# Altium schematic sheet main.SchDoc: Наименование
size 594 x 420 mm; ApprovedBy: Утвердил; CheckedBy: Проверил; Author: Разработал; CompanyName: Организация; SheetNumber: 1; SheetTotal: 9; PageSetup: Record=PageOptions|CenterHorizontal=True|CenterVertical=True|PrintScale=0.94|XCorrection=1.00|YCorrection=1.00|PrintKind=1|BorderSize=5000000|LeftOffset=0|BottomOffset=0|Orientation=1|PaperLength=1000|PaperWidth=1000|Scale=100|PaperSource=7|PrintQuality=-4|MediaType=1|DitherType=10|PaperKind=A4|PrintScaleMode=1; DecimalNumber: Децимальный номер; HeadOfSector: Нач. сектора; MainDevice: Перв.примен.; Name1: Наименование1; lit_A: О; n_kontr: Н. Контр; t_kontr: Т. Контр; Name2: Наименование2; DocumentName: Sheet1.SCHDOC
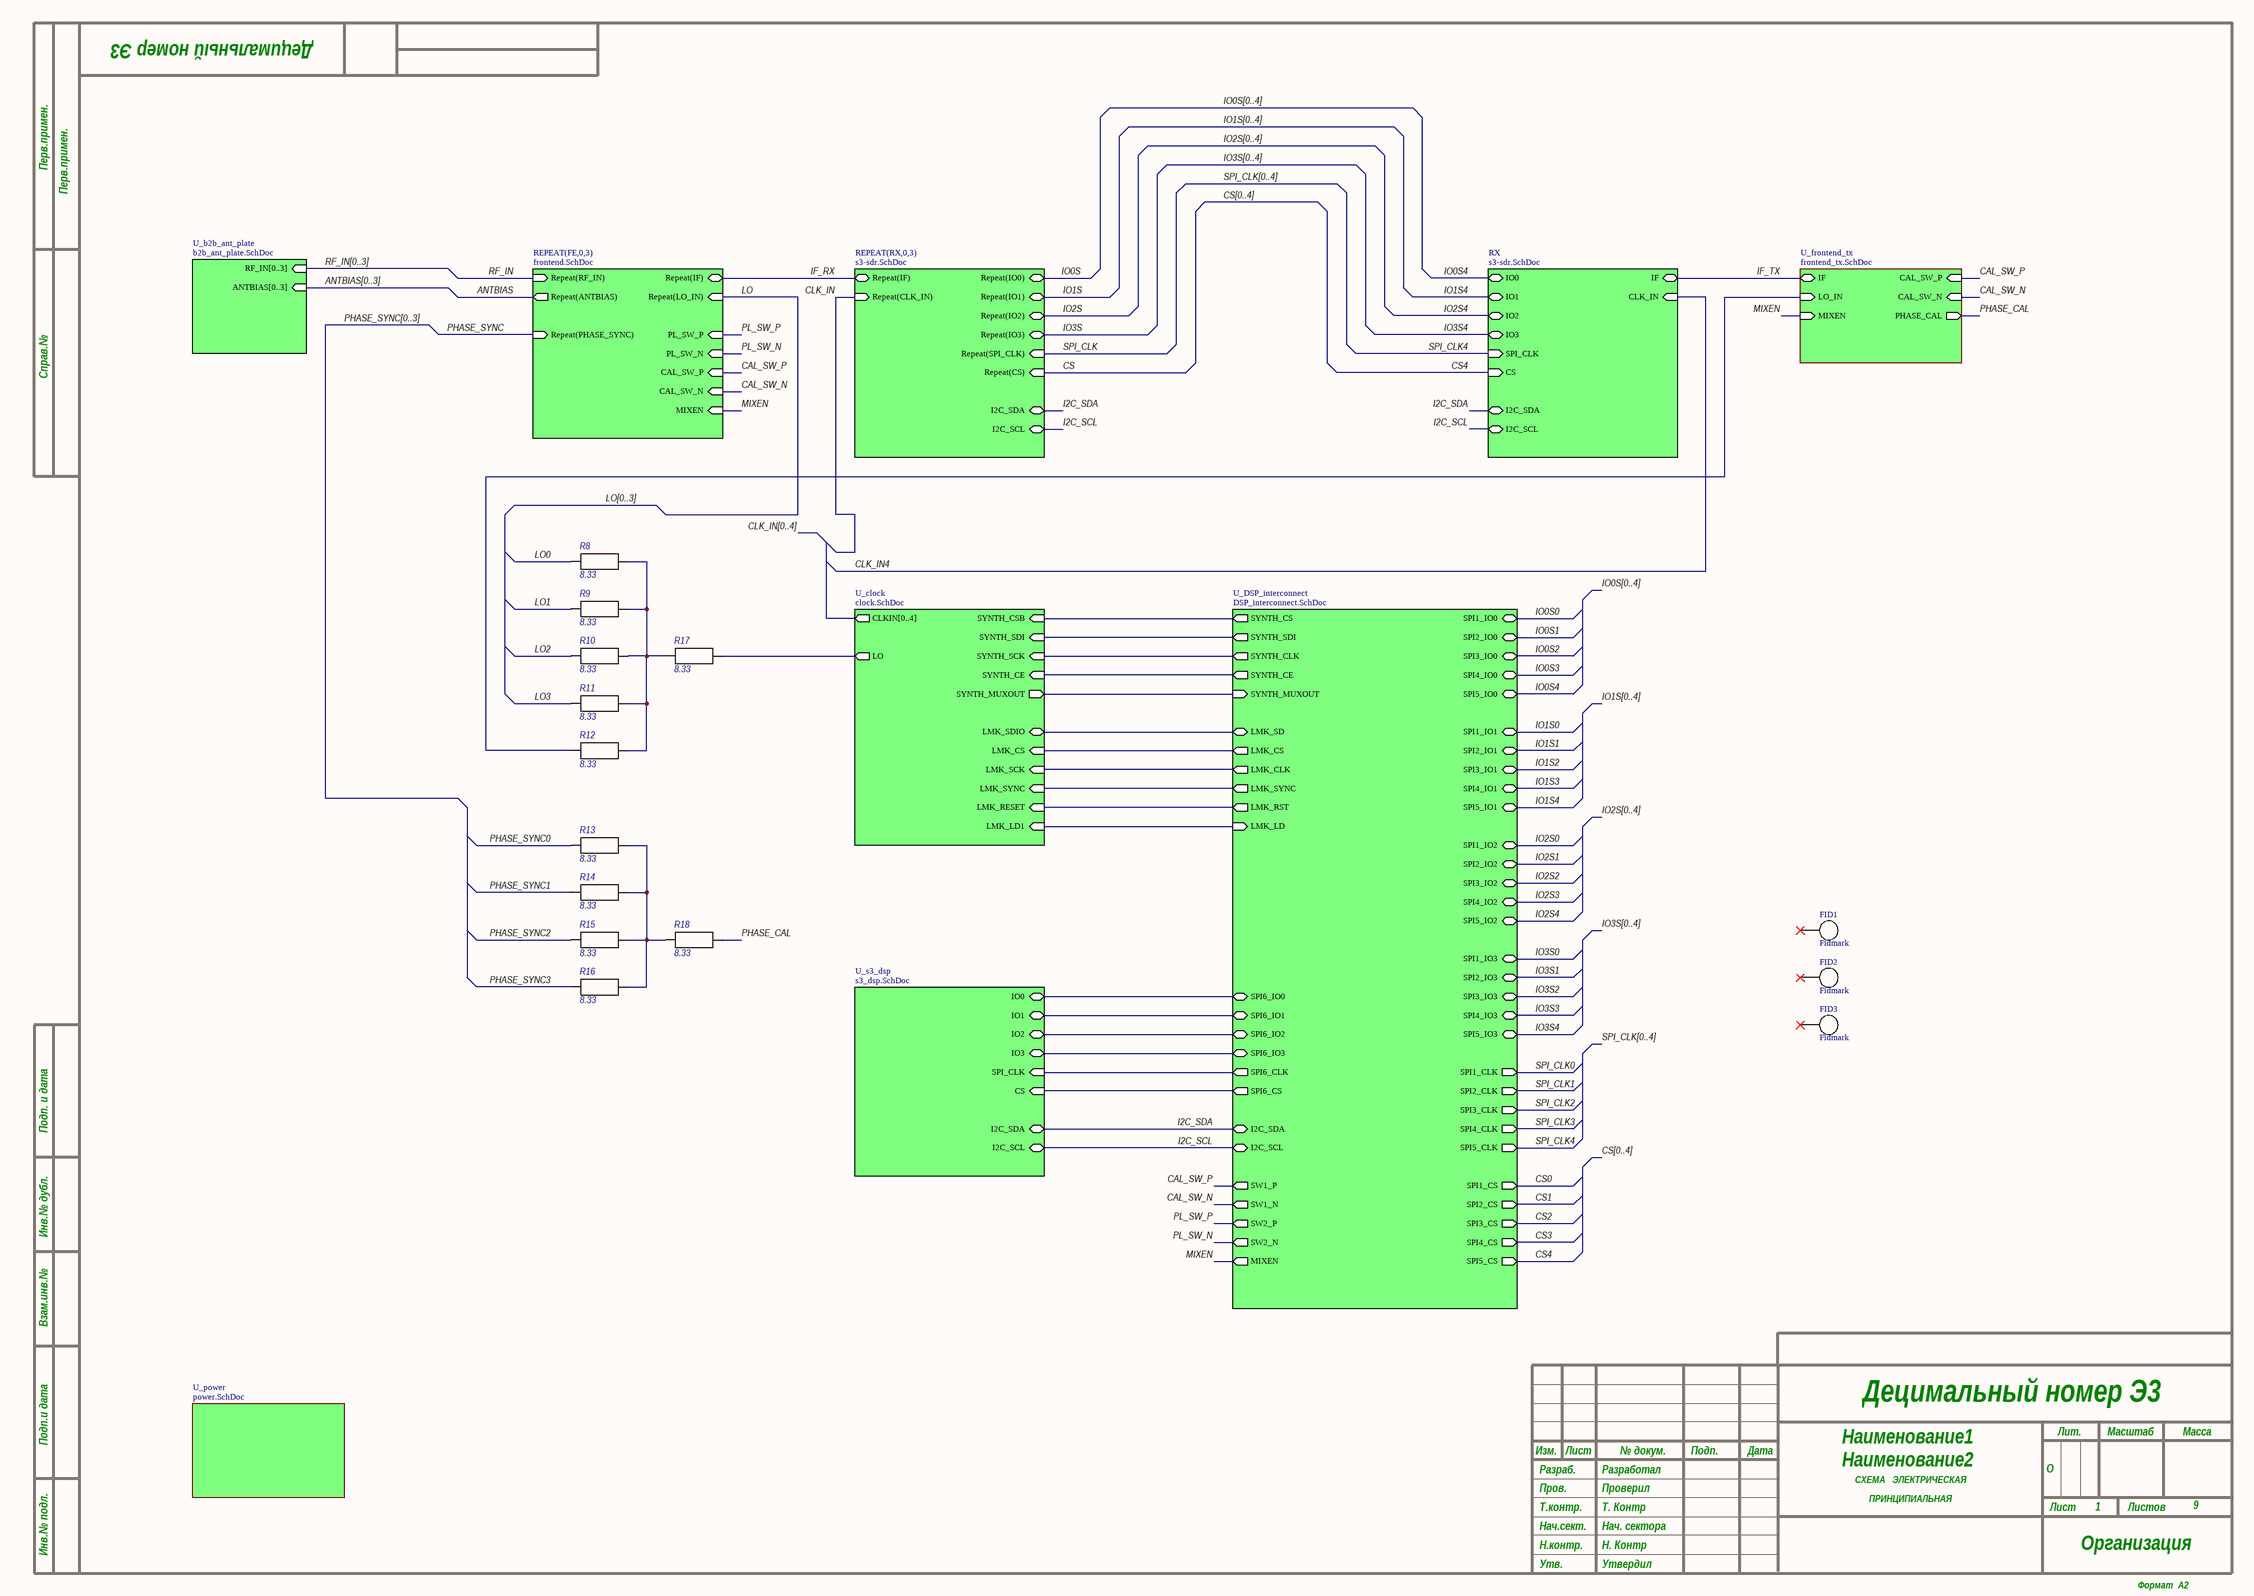
[diagram p0: main.SchDoc]

## Parts
FID1  Fidmark  [FidMark]  (no BOM)
FID2  Fidmark  [FidMark]  (no BOM)
FID3  Fidmark  [FidMark]  (no BOM)
R8  8.33  [C0402R]
R9  8.33  [C0402R]
R10  8.33  [C0402R]
R11  8.33  [C0402R]
R12  8.33  [C0402R]
R13  8.33  [C0402R]
R14  8.33  [C0402R]
R15  8.33  [C0402R]
R16  8.33  [C0402R]
R17  8.33  [C0402R]
R18  8.33  [C0402R]

## Sub-sheets
REPEAT(FE,0,3) = frontend.SchDoc: Repeat(IF) (bidir), Repeat(LO_IN) (in), Repeat(RF_IN) (in), Repeat(PHASE_SYNC) (in), Repeat(ANTBIAS) (out), PL_SW_P (in), PL_SW_N (in), CAL_SW_P (in), CAL_SW_N (in), MIXEN (in)
REPEAT(RX,0,3) = s3-sdr.SchDoc: Repeat(IF) (bidir), Repeat(CLK_IN) (in), Repeat(IO0) (bidir), Repeat(IO1) (bidir), Repeat(IO2) (bidir), Repeat(IO3) (bidir), Repeat(SPI_CLK) (in), Repeat(CS) (in), I2C_SDA (bidir), I2C_SCL (bidir)
RX = s3-sdr.SchDoc: IF (bidir), CLK_IN (in), IO0 (bidir), IO1 (bidir), IO2 (bidir), IO3 (bidir), SPI_CLK (in), CS (in), I2C_SDA (bidir), I2C_SCL (bidir)
U_b2b_ant_plate = b2b_ant_plate.SchDoc: RF_IN[0..3] (in), ANTBIAS[0..3] (in)
U_clock = clock.SchDoc: SYNTH_CSB (in), SYNTH_SDI (in), SYNTH_SCK (in), SYNTH_CE (in), SYNTH_MUXOUT (out), LO (out), CLKIN[0..4] (out), LMK_SCK (in), LMK_SDIO (bidir), LMK_CS (in), LMK_SYNC (in), LMK_RESET (in), LMK_LD1 (in)
U_DSP_interconnect = DSP_interconnect.SchDoc: SPI1_CLK (out), SPI1_CS (out), SPI1_IO0 (bidir), SPI1_IO1 (bidir), SPI1_IO2 (bidir), SPI1_IO3 (bidir), SPI2_IO3 (bidir), SPI2_CS (out), SPI2_IO0 (bidir), SPI2_CLK (out), SPI2_IO1 (bidir), SPI2_IO2 (bidir), SPI3_IO3 (bidir), SPI3_CS (out), SPI3_IO0 (bidir), SPI3_IO1 (bidir), SPI3_IO2 (bidir), SPI3_CLK (out), SPI4_IO0 (bidir), SPI4_IO1 (bidir), SPI4_IO2 (bidir), SPI4_IO3 (bidir), SPI4_CS (out), SPI4_CLK (out), SPI5_IO0 (bidir), SPI5_IO3 (bidir), SPI5_CS (out), SPI5_CLK (out), SPI5_IO1 (bidir), SPI5_IO2 (bidir), SYNTH_CS (out), SYNTH_CLK (out), SYNTH_MUXOUT (in), SYNTH_SDI (out), SYNTH_CE (out), LMK_CLK (out), LMK_CS (out), LMK_SD (bidir), LMK_RST (out), LMK_SYNC (out), LMK_LD (in), I2C_SDA (bidir), I2C_SCL (bidir), SW1_N (out), SW1_P (out), SW2_P (out), SW2_N (out), MIXEN (out), SPI6_IO3 (bidir), SPI6_CS (out), SPI6_IO0 (bidir), SPI6_CLK (out), SPI6_IO1 (bidir), SPI6_IO2 (bidir)
U_frontend_tx = frontend_tx.SchDoc: LO_IN (in), IF (bidir), MIXEN (in), CAL_SW_N (in), CAL_SW_P (in), PHASE_CAL (out)
U_power = power.SchDoc: no entries
U_s3_dsp = s3_dsp.SchDoc: IO0 (bidir), IO1 (bidir), IO2 (bidir), IO3 (bidir), SPI_CLK (in), CS (in), I2C_SDA (bidir), I2C_SCL (bidir)

## Nets
ANTBIAS: sheet REPEAT(FE,0,3)/Repeat(ANTBIAS)
CAL_SW_N: sheet REPEAT(FE,0,3)/CAL_SW_N, sheet U_frontend_tx/CAL_SW_N, sheet U_DSP_interconnect/SW1_N
CAL_SW_P: sheet REPEAT(FE,0,3)/CAL_SW_P, sheet U_frontend_tx/CAL_SW_P, sheet U_DSP_interconnect/SW1_P
CLK_IN: sheet REPEAT(RX,0,3)/Repeat(CLK_IN)
CLK_IN4: sheet RX/CLK_IN
CS: sheet REPEAT(RX,0,3)/Repeat(CS)
CS0: sheet U_DSP_interconnect/SPI1_CS
CS1: sheet U_DSP_interconnect/SPI2_CS
CS2: sheet U_DSP_interconnect/SPI3_CS
CS3: sheet U_DSP_interconnect/SPI4_CS
CS4: sheet RX/CS, sheet U_DSP_interconnect/SPI5_CS
I2C_SCL: sheet REPEAT(RX,0,3)/I2C_SCL, sheet RX/I2C_SCL, sheet U_DSP_interconnect/I2C_SCL, sheet U_s3_dsp/I2C_SCL
I2C_SDA: sheet REPEAT(RX,0,3)/I2C_SDA, sheet RX/I2C_SDA, sheet U_DSP_interconnect/I2C_SDA, sheet U_s3_dsp/I2C_SDA
IF_RX: sheet REPEAT(FE,0,3)/Repeat(IF), sheet REPEAT(RX,0,3)/Repeat(IF)
IF_TX: sheet RX/IF, sheet U_frontend_tx/IF
IO0S: sheet REPEAT(RX,0,3)/Repeat(IO0)
IO0S0: sheet U_DSP_interconnect/SPI1_IO0
IO0S1: sheet U_DSP_interconnect/SPI2_IO0
IO0S2: sheet U_DSP_interconnect/SPI3_IO0
IO0S3: sheet U_DSP_interconnect/SPI4_IO0
IO0S4: sheet RX/IO0, sheet U_DSP_interconnect/SPI5_IO0
IO1S: sheet REPEAT(RX,0,3)/Repeat(IO1)
IO1S0: sheet U_DSP_interconnect/SPI1_IO1
IO1S1: sheet U_DSP_interconnect/SPI2_IO1
IO1S2: sheet U_DSP_interconnect/SPI3_IO1
IO1S3: sheet U_DSP_interconnect/SPI4_IO1
IO1S4: sheet RX/IO1, sheet U_DSP_interconnect/SPI5_IO1
IO2S: sheet REPEAT(RX,0,3)/Repeat(IO2)
IO2S0: sheet U_DSP_interconnect/SPI1_IO2
IO2S1: sheet U_DSP_interconnect/SPI2_IO2
IO2S2: sheet U_DSP_interconnect/SPI3_IO2
IO2S3: sheet U_DSP_interconnect/SPI4_IO2
IO2S4: sheet RX/IO2, sheet U_DSP_interconnect/SPI5_IO2
IO3S: sheet REPEAT(RX,0,3)/Repeat(IO3)
IO3S0: sheet U_DSP_interconnect/SPI1_IO3
IO3S1: sheet U_DSP_interconnect/SPI2_IO3
IO3S2: sheet U_DSP_interconnect/SPI3_IO3
IO3S3: sheet U_DSP_interconnect/SPI4_IO3
IO3S4: sheet RX/IO3, sheet U_DSP_interconnect/SPI5_IO3
LO: sheet REPEAT(FE,0,3)/Repeat(LO_IN)
LO0: R8.2
LO1: R9.2
LO2: R10.2
LO3: R11.2
MIXEN: sheet REPEAT(FE,0,3)/MIXEN, sheet U_frontend_tx/MIXEN, sheet U_DSP_interconnect/MIXEN
PHASE_CAL: R18.1 ; sheet U_frontend_tx/PHASE_CAL
PHASE_SYNC: sheet REPEAT(FE,0,3)/Repeat(PHASE_SYNC)
PHASE_SYNC0: R13.2
PHASE_SYNC1: R14.2
PHASE_SYNC2: R15.2
PHASE_SYNC3: R16.2
PL_SW_N: sheet REPEAT(FE,0,3)/PL_SW_N, sheet U_DSP_interconnect/SW2_N
PL_SW_P: sheet REPEAT(FE,0,3)/PL_SW_P, sheet U_DSP_interconnect/SW2_P
RF_IN: sheet REPEAT(FE,0,3)/Repeat(RF_IN)
SPI_CLK: sheet REPEAT(RX,0,3)/Repeat(SPI_CLK)
SPI_CLK0: sheet U_DSP_interconnect/SPI1_CLK
SPI_CLK1: sheet U_DSP_interconnect/SPI2_CLK
SPI_CLK2: sheet U_DSP_interconnect/SPI3_CLK
SPI_CLK3: sheet U_DSP_interconnect/SPI4_CLK
SPI_CLK4: sheet RX/SPI_CLK, sheet U_DSP_interconnect/SPI5_CLK
NetR8_1: R8.1 R9.1 R10.1 R11.1 R12.1 R17.2
NetR12_2: R12.2 ; sheet U_frontend_tx/LO_IN
NetR13_1: R13.1 R14.1 R15.1 R16.1 R18.2
NetR17_1: R17.1 ; sheet U_clock/LO
(unnamed): sheet U_clock/SYNTH_CSB, sheet U_DSP_interconnect/SYNTH_CS
(unnamed): sheet U_clock/SYNTH_SDI, sheet U_DSP_interconnect/SYNTH_SDI
(unnamed): sheet U_clock/SYNTH_SCK, sheet U_DSP_interconnect/SYNTH_CLK
(unnamed): sheet U_clock/SYNTH_CE, sheet U_DSP_interconnect/SYNTH_CE
(unnamed): sheet U_clock/SYNTH_MUXOUT, sheet U_DSP_interconnect/SYNTH_MUXOUT
(unnamed): sheet U_clock/LMK_SCK, sheet U_DSP_interconnect/LMK_CLK
(unnamed): sheet U_clock/LMK_SDIO, sheet U_DSP_interconnect/LMK_SD
(unnamed): sheet U_clock/LMK_CS, sheet U_DSP_interconnect/LMK_CS
(unnamed): sheet U_clock/LMK_SYNC, sheet U_DSP_interconnect/LMK_SYNC
(unnamed): sheet U_clock/LMK_RESET, sheet U_DSP_interconnect/LMK_RST
(unnamed): sheet U_clock/LMK_LD1, sheet U_DSP_interconnect/LMK_LD
(unnamed): sheet U_DSP_interconnect/SPI6_IO3, sheet U_s3_dsp/IO3
(unnamed): sheet U_DSP_interconnect/SPI6_CS, sheet U_s3_dsp/CS
(unnamed): sheet U_DSP_interconnect/SPI6_IO0, sheet U_s3_dsp/IO0
(unnamed): sheet U_DSP_interconnect/SPI6_CLK, sheet U_s3_dsp/SPI_CLK
(unnamed): sheet U_DSP_interconnect/SPI6_IO1, sheet U_s3_dsp/IO1
(unnamed): sheet U_DSP_interconnect/SPI6_IO2, sheet U_s3_dsp/IO2

Not connected (* = marked no-connect by the designer): FID1 1*; FID2 1*; FID3 1*

## Buses and harness runs
bus ANTBIAS[0..3] = sheet U_b2b_ant_plate/ANTBIAS[0..3]
bus CLK_IN[0..4] = sheet U_clock/CLKIN[0..4]
bus CS[0..4]
bus IO0S[0..4]
bus IO1S[0..4]
bus IO2S[0..4]
bus IO3S[0..4]
bus LO[0..3]
bus PHASE_SYNC[0..3]
bus RF_IN[0..3] = sheet U_b2b_ant_plate/RF_IN[0..3]
bus SPI_CLK[0..4]

## Notes on the sheet
- Перв.примен.
- Справ.№
- Подп. и дата
- Инв.№ дубл.
- Взам.инв.№
- Подп.и дата
- Разраб.
- Изм.
- Лист
- № докум.
- Подп.
- Дата
- Лит.
- Масштаб
- Масса
- Т.контр.
- Пров.
- СХЕМА   ЭЛЕКТРИЧЕСКАЯ
- ПРИНЦИПИАЛЬНАЯ
- Листов
- Инв.№ подл.
- Утв.
- Н.контр.
- Нач.сект.
- Формат  A2

## Library data of the parts
R8-R18 = res: Value: 8.33